# Altium schematic sheet primary_koruma.SchDoc
size A4
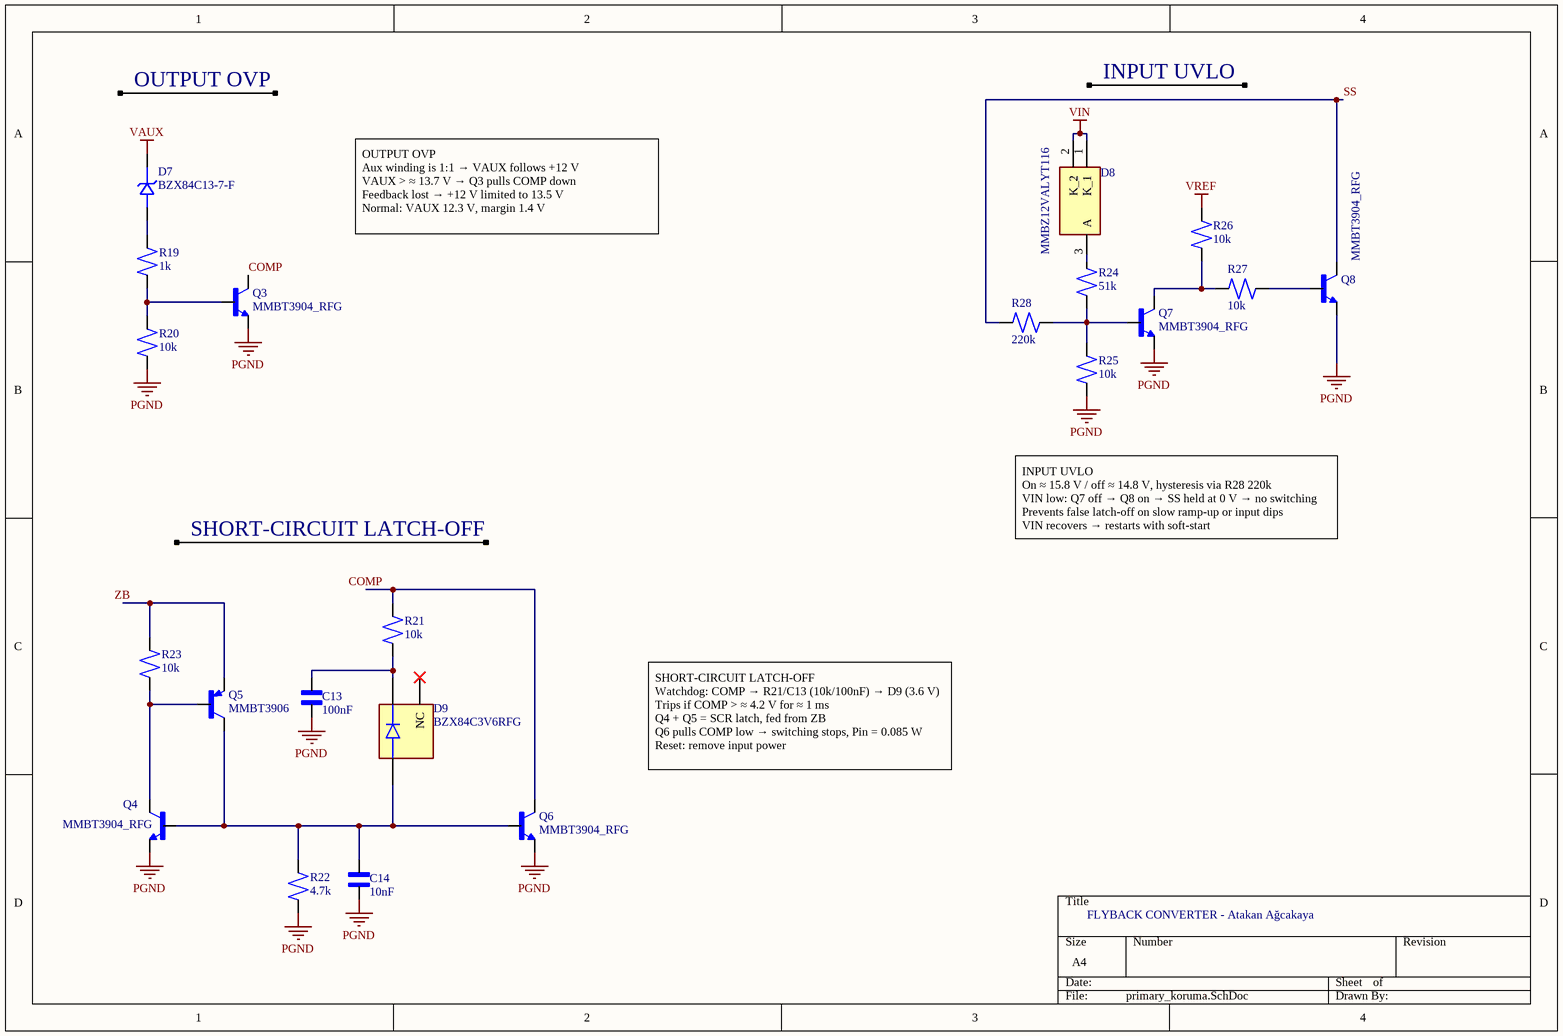
[diagram p0: primary_koruma.SchDoc]

## Parts
C13  100nF  [CAPC2012X145N]
C14  10nF  [CAPC2012X145N]
D7  BZX84C13-7-F  [SOT91P240X105-3N]
D8  MMBZ12VALYT116  [SOT95P240X115-3N]
D9  BZX84C3V6RFG  [SOT95P237X112-3N]
Q3  MMBT3904_RFG  [SOT95P237X112-3N]
Q4  MMBT3904_RFG  [SOT95P237X112-3N]
Q5  MMBT3906  [SOT95P260X140-3N]
Q6  MMBT3904_RFG  [SOT95P237X112-3N]
Q7  MMBT3904_RFG  [SOT95P237X112-3N]
Q8  MMBT3904_RFG  [SOT95P237X112-3N]
R19  1k  [RESC2012X60N]
R20  10k  [RESC2012X60N]
R21  10k  [RESC2012X60N]
R22  4.7k  [RESC2012X60N]
R23  10k  [RESC2012X60N]
R24  51k  [RESC2012X60N]
R25  10k  [RESC2012X60N]
R26  10k  [RESC2012X60N]
R27  10k  [RESC2012X60N]
R28  220k  [RESC2012X60N]

## Nets
PGND: C13.1 C14.1 Q3.2(E) Q4.2(E) Q6.2(E) Q7.2(E) Q8.2(E) R20.1 R22.1 R25.2
VAUX: D7.3(CATHODE)
VIN: D8.1(K_1) D8.2(K_2)
VREF: R26.1
COMP: Q3.3(C) Q6.3(C) R21.2
SS: Q8.3(C) R28.2
ZB: Q5.2(E) R23.2
NetC13_2: C13.2 D9.3(K) R21.1
NetC14_2: C14.2 D9.1(A) Q4.1(B) Q5.3(C) Q6.1(B) R22.2
NetD7_1: D7.1(ANODE) R19.2
NetD8_3: D8.3(A) R24.2
NetQ3_1: Q3.1(B) R19.1 R20.2
NetQ4_3: Q4.3(C) Q5.1(B) R23.1
NetQ7_1: Q7.1(B) R24.1 R25.1 R28.1
NetQ7_3: Q7.3(C) R26.2 R27.1
NetQ8_1: Q8.1(B) R27.2

Not connected (* = marked no-connect by the designer): D9 2(NC)*

## Notes on the sheet
- OUTPUT OVP
- INPUT UVLO
- OUTPUT OVP
  Aux winding is 1:1 → VAUX follows +12 V
  VAUX > ≈ 13.7 V → Q3 pulls COMP down
  Feedback lost → +12 V limited to 13.5 V
  Normal: VAUX 12.3 V, margin 1.4 V
- SHORT-CIRCUIT LATCH-OFF
- INPUT UVLO
  On ≈ 15.8 V / off ≈ 14.8 V, hysteresis via R28 220k
  VIN low: Q7 off → Q8 on → SS held at 0 V → no switching
  Prevents false latch-off on slow ramp-up or input dips
  VIN recovers → restarts with soft-start
- SHORT-CIRCUIT LATCH-OFF
  Watchdog: COMP → R21/C13 (10k/100nF) → D9 (3.6 V)
  Trips if COMP > ≈ 4.2 V for ≈ 1 ms
  Q4 + Q5 = SCR latch, fed from ZB
  Q6 pulls COMP low → switching stops, Pin = 0.085 W
  Reset: remove input power
- FLYBACK CONVERTER - Atakan Ağcakaya

## Library data of the parts
C13 C14 = C_0805
  C13: Value: 100nF
  C14: Value: 10nF
D7 = BZX84C13-7-F: Zener Diode 13 V 300 mW Â±6.54% Surface Mount SOT-23-3; MF: Diodes Inc.; SnapEDA_Link: https://www.snapeda.com/parts/BZX84C13-7-F/Diodes+Inc./view-part/?ref=snap; Package: SOT-23 Diodes Inc.; Value: *; MP: BZX84C13-7-F; Check_prices: https://www.snapeda.com/parts/BZX84C13-7-F/Diodes+Inc./view-part/?ref=eda
D8 = MMBZ12VALYT116: 8.5V, SOT-23, Dual Line, Anode Common Transient Voltage Suppressor; Manufacturer_Name: ROHM Semiconductor; Geometry.Height: 1.15mm; Manufacturer_Part_Number: MMBZ12VALYT116; Mouser Part Number: 755-MMBZ12VALYT116; Mouser Price/Stock: https://www.mouser.co.uk/ProductDetail/ROHM-Semiconductor/MMBZ12VALYT116?qs=QNEnbhJQKvYQxyBM5QcKxw%3D%3D; Arrow Part Number: *; Arrow Price/Stock: *; Datasheet Link: https://fscdn.rohm.com/en/products/databook/datasheet/discrete/diode/zener/mmbz12valyt116-e.pdf
D9 = BZX84C3V6RFG: Diode Zener Single 3.6V 5% 0.3W 3-Pin SOT-23 Plastic T/R; MF: Taiwan Semiconductor; SnapEDA_Link: https://www.snapeda.com/parts/BZX84C3V6RFG/taiwan/view-part/?ref=snap; Package: SOT-23 Taiwan Semiconductor; Value: *; MP: BZX84C3V6RFG; Check_prices: https://www.snapeda.com/parts/BZX84C3V6RFG/taiwan/view-part/?ref=eda
Q3 Q4 Q6-Q8 = MMBT3904_RFG: SOT-23, 60V, 0.2A, NPN Transistor; MF: Taiwan Semiconductor; MP: MMBT3904 RFG; SnapEDA_Link: https://www.snapeda.com/parts/MMBT3904%20RFG/taiwan/view-part/?ref=snap; Package: SOT-23-3 Taiwan Semiconductor; Value: *; Check_prices: https://www.snapeda.com/parts/MMBT3904%20RFG/taiwan/view-part/?ref=eda
Q5 = MMBT3906: Bipolar (BJT) Transistor PNP 40 V 200 mA 300MHz 200 mW Surface Mount SOT-23; MF: MDD; SnapEDA_Link: https://www.snapeda.com/parts/MMBT3906/MDD/view-part/?ref=snap; Package: None; Value: *; MP: MMBT3906; Check_prices: https://www.snapeda.com/parts/MMBT3906/MDD/view-part/?ref=eda
R19-R28 = R_0805
  R19: Value: 1k
  R20 R21 R23 R25-R27: Value: 10k
  R22: Value: 4.7k
  R24: Value: 51k
  R28: Value: 220k